# Altium schematic sheet Connector_Section.SchDoc
size A4
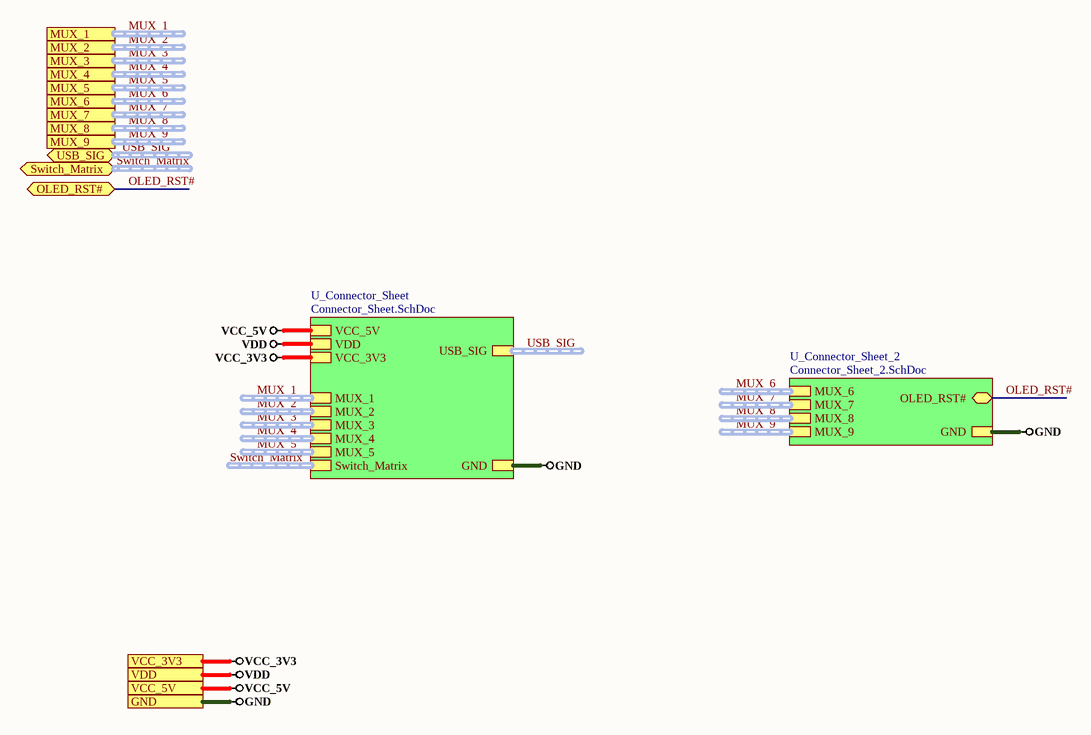
[diagram p0: Connector_Section.SchDoc]

## Sub-sheets
U_Connector_Sheet = Connector_Sheet.SchDoc: USB_SIG (harness USB_SIG), GND, VCC_5V, MUX_1 (harness MUX_1), MUX_2 (harness MUX_2), MUX_3 (harness MUX_3), MUX_4 (harness MUX_4), MUX_5 (harness MUX_5), VDD, VCC_3V3, Switch_Matrix (harness Switch_Matrix)
U_Connector_Sheet_2 = Connector_Sheet_2.SchDoc: GND, MUX_8 (harness MUX_8), MUX_9 (harness MUX_9), MUX_7 (harness MUX_7), MUX_6 (harness MUX_6), OLED_RST# (bidir)

## Ports
GND, MUX_1 (harness MUX_1), MUX_2 (harness MUX_2), MUX_3 (harness MUX_3), MUX_4 (harness MUX_4), MUX_5 (harness MUX_5), MUX_6 (harness MUX_6), MUX_7 (harness MUX_7), MUX_8 (harness MUX_8), MUX_9 (harness MUX_9), OLED_RST# (bidir), Switch_Matrix (bidir, harness Switch_Matrix), USB_SIG (bidir, harness USB_SIG), VCC_3V3, VCC_5V, VDD

## Nets
GND: port GND, sheet U_Connector_Sheet/GND, sheet U_Connector_Sheet_2/GND
VCC_3V3: port VCC_3V3, sheet U_Connector_Sheet/VCC_3V3
VCC_5V: port VCC_5V, sheet U_Connector_Sheet/VCC_5V
VDD: port VDD, sheet U_Connector_Sheet/VDD
OLED_RST#: port OLED_RST#, sheet U_Connector_Sheet_2/OLED_RST#

## Buses and harness runs
harness MUX_1 = port MUX_1
harness MUX_1 = sheet U_Connector_Sheet/MUX_1
harness MUX_2 = port MUX_2
harness MUX_2 = sheet U_Connector_Sheet/MUX_2
harness MUX_3 = port MUX_3
harness MUX_3 = sheet U_Connector_Sheet/MUX_3
harness MUX_4 = port MUX_4
harness MUX_4 = sheet U_Connector_Sheet/MUX_4
harness MUX_5 = port MUX_5
harness MUX_5 = sheet U_Connector_Sheet/MUX_5
harness MUX_6 = port MUX_6
harness MUX_6 = sheet U_Connector_Sheet_2/MUX_6
harness MUX_7 = port MUX_7
harness MUX_7 = sheet U_Connector_Sheet_2/MUX_7
harness MUX_8 = port MUX_8
harness MUX_8 = sheet U_Connector_Sheet_2/MUX_8
harness MUX_9 = port MUX_9
harness MUX_9 = sheet U_Connector_Sheet_2/MUX_9
harness Switch_Matrix = port Switch_Matrix
harness Switch_Matrix = sheet U_Connector_Sheet/Switch_Matrix
harness USB_SIG = port USB_SIG
harness USB_SIG = sheet U_Connector_Sheet/USB_SIG

## Notes on the sheet
- 1
- Huzaifa Ali